# Altium schematic sheet V_ver2.SchDoc
size A4
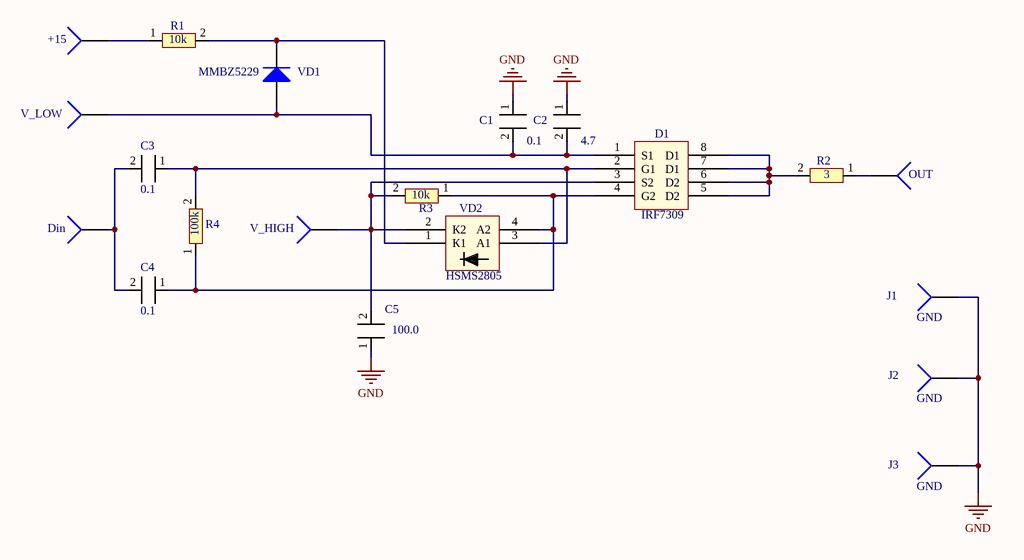
[diagram p0: V_ver2.SchDoc]

## Parts
+15  (no value)  [PIN1]
C1  0.1  [CAP_SMALL]
C2  4.7  [CAP_SMALL]
C3  0.1  [CAP_SMALL]
C4  0.1  [CAP_SMALL]
C5  100.0  [CAP_SMALL]
D1  IRF7309  [SOIC127P600X175-8N]
Din  (no value)  [PIN1]
J1  GND  [PIN1]
J2  GND  [PIN1]
J3  GND  [PIN1]
OUT  (no value)  [PIN1]
R1  10k  [RES]
R2  3  [RES]
R3  10k  [RES]
R4  100k  [RES]
V_HIGH  (no value)  [PIN1]
V_LOW  (no value)  [PIN1]
VD1  MMBZ5229  [SOT-23_N]
VD2  HSMS2805  [SOT-143B]

## Nets
GND: C1.1 C2.1 C5.1 J1.1 J2.1 J3.1
Net+15_1: +15.1 R1.1
NetC1_2: C1.2 C2.2 D1.1(S1) V_LOW.1 VD1.1(A)
NetC3_1: C3.1 D1.2(G1) R4.2 VD2.3(А1)
NetC3_2: C3.2 C4.2 Din.1
NetC4_1: C4.1 D1.4(G2) R3.1 R4.1 VD2.4(А2)
NetC5_2: C5.2 D1.3(S2) R3.2 V_HIGH.1 VD2.2(К2)
NetD1_5: D1.5(D2) D1.6(D2) D1.7(D1) D1.8(D1) R2.2
NetOUT_1: OUT.1 R2.1
NetR1_2: R1.2 VD1.3(K) VD2.1(К1)

## Library data of the parts
+15 Din J1-J3 OUT V_HIGH V_LOW = Socket: LatestRevisionDate: 17-Jul-2002; LatestRevisionNote: Re-released for DXP Platform.; Publisher: Altium Limited
C1-C5 = CAP_SMALL
R1-R4 = RES
VD1 = Diode BAS16: Silicon Switching Diode for High-Speed Switching; Note: Pin 2 is not connected and not drawn.; Published: 21-Mar-2003; LatestRevisionDate: 29-May-2009; LatestRevisionNote: IPC-7351 Footprint Added.; DatasheetVersion: Oct-1999; PackageVersion: Sep-2001; PackageReference: SOT-23; Publisher: Altium Limited; PackageDescription: 3-Pin SOT-23 Package 0.95 mm Pitch, 2.5 mm Lead Span; ComponentLink1Description: Manufacturer Link; ComponentLink1URL: http://www.infineon.com/; ComponentLink2Description: Datasheet; ComponentLink2URL: http://www.infineon.com/upload/Document/cmc_upload/documents/012/5331/bas16series.pdf
VD2 = HSMS-2805